# Altium schematic sheet CW341_PowerMeasure.SchDoc: <Enter Sheet Title>
size Letter; Organization: NewAE Technology Inc.; Address1: 1083 Queen St., Suite 196; Address2: Halifax; Address3: NS; Address4: Canada B3H 0B2; SheetNumber: 12; SheetTotal: 16; SheetApproved: NO
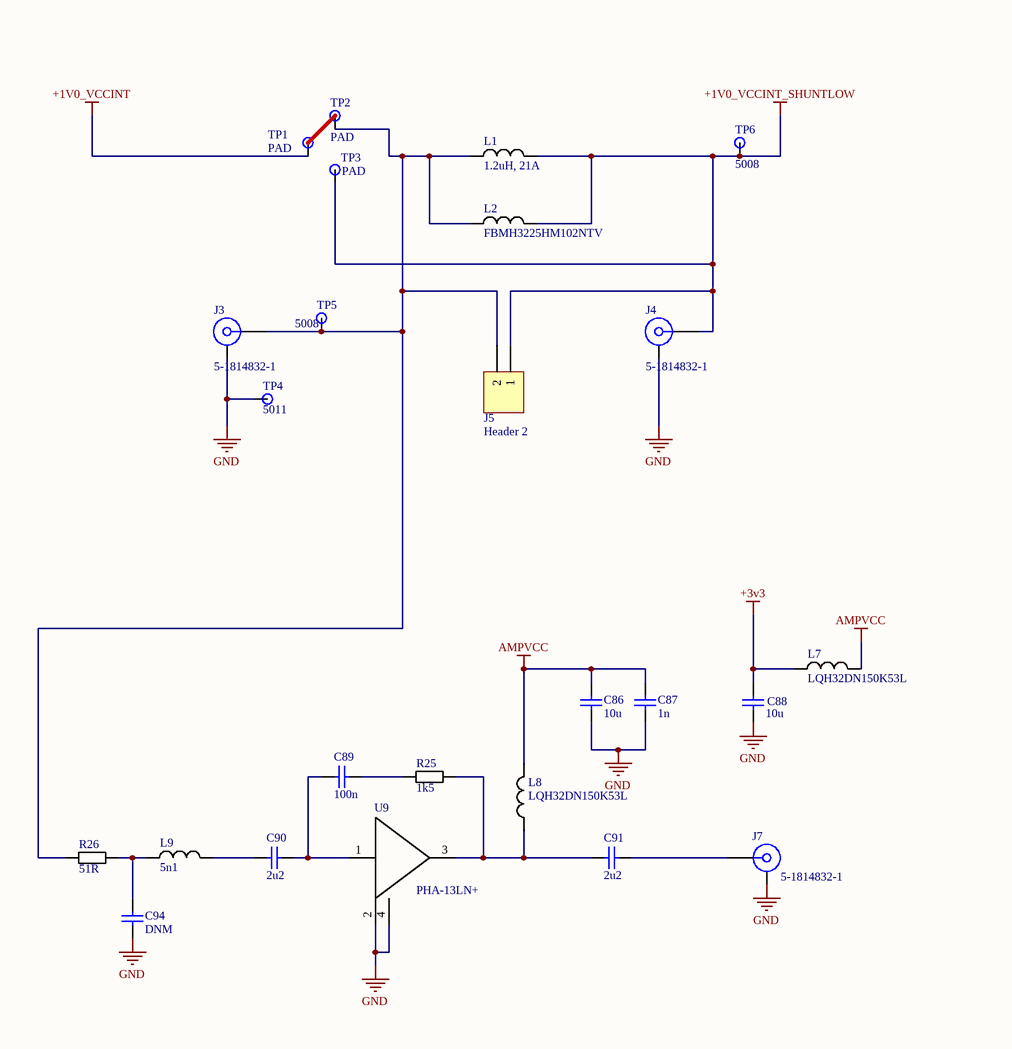
[diagram p0: CW341_PowerMeasure.SchDoc, left]
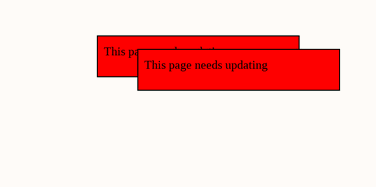
[diagram p1: CW341_PowerMeasure.SchDoc, right]

## Parts
C86  10u  [CAPC0603_M]
C87  1n  [CAPC0603_M]
C88  10u  [CAPC0603_M]
C89  100n  [CAPC0402_M]
C90  2u2  [CAPC0603_M]
C91  2u2  [CAPC0603_M]
C94  DNM  [CAPC0603_M]
J3  5-1814832-1  [SMA_VERT_1.65MMHOLE]
J4  5-1814832-1  [SMA_VERT_1.65MMHOLE]
J5  Header 2  [HDR1X2]
J7  5-1814832-1  [SMA_VERT_1.65MMHOLE]
L1  1.2uH, 21A  [XAL7070-122]
L2  FBMH3225HM102NTV  [INDC3225X06N]
L7  LQH32DN150K53L  [INDC3225X06N]
L8  LQH32DN150K53L  [INDC3225X06N_LQH32]
L9  5n1  [IND_0603]
R25  1k5  [RESC1608X55N]
R26  51R  [RESC1608X55N]
TP1  PAD  [9022-0-00-15-00-00-33-0]
TP2  PAD  [9022-0-00-15-00-00-33-0]
TP3  PAD  [9022-0-00-15-00-00-33-0]
TP4  5011  [KEYSTONE5011]
TP5  5008  [KEYSTONE5008]
TP6  5008  [KEYSTONE5008]
U9  PHA-13LN+  [PHA13LN]

## Nets
+1V0_VCCINT: TP1.1
+1V0_VCCINT_SHUNTLOW: J4.1 J5.1 L1.2 L2.2 TP3.1 TP6.1
+3v3: C88.1 L7.1
AMPVCC: C86.2 C87.2 L7.2 L8.2
GND: C86.1 C87.1 C88.2 C94.2 J3.MH J4.MH J7.MH TP4.1 U9.2(GROUND_1) U9.4(GROUND_2)
NetC89_1: C89.1 C90.2 U9.1(RF-IN)
NetC89_2: C89.2 R25.1
NetC90_1: C90.1 L9.2
NetC91_1: C91.1 L8.1 R25.2 U9.3(RF-OUT_&_DC-IN)
NetC91_2: C91.2 J7.1
NetC94_1: C94.1 L9.1 R26.2
NetJ3_1: J3.1 J5.2 L1.1 L2.1 R26.1 TP2.1 TP5.1

## Notes on the sheet
- This page needs updating
- Title:
- Date:
- Rev:
- Time:
- Project:
- Sheet
- of
- License:
- Copyright © NewAE Technology Inc.
- Approved:
- NewAE.com
- File:

## Library data of the parts
C86 C88 = CCHIP-10u-0603: 10u, 0603; Manufacture Part Number 1: GRM188R61C106MA73D; Component Group: Capacitor; Case-EIA: 0603; Case-Metric: 1608; Part Number: CCHIP-10u-0603; Footprint: 0603; Pin Count: 2; Supplier 1: Digi-Key; Supplier Part Number 1: 490-7201-1-ND; Value: 10u; Mounting Technology: SMT; Component Kind: Standard; Component Type: Standard
C87 = CCHIP-1n-0603: 1n, 0603; Manufacture 1: AVX; Manufacture Part Number 1: 06033D102KAT2A; Component Group: Capacitor; Case-EIA: 0603; Case-Metric: 1608; Rated Voltage: 50VDC; Part Number: CCHIP-1n-0603; Footprint: 0603; Pin Count: 2; Supplier 1: Digi-Key; Value: 1n; Mounting Technology: SMT; Component Kind: Standard; Component Type: Standard
C89 = CCHIP-100n-0402: 100n, 0402; Manufacture Part Number 1: CGA2B3X7R1V104K050BB; Component Group: Capacitor; Case-EIA: 0402; Part Number: CCHIP-100n-0402; Footprint: 0402; Pin Count: 2; Supplier 1: Digi-Key; Supplier Part Number 1: 445-6901-1-ND; Value: 100n; Mounting Technology: SMT; Component Kind: Standard; Component Type: Standard
C90 C91 = CCHIP-2u2-0603: 2u2, 0603; Manufacture 1: Samsung; Manufacture Part Number 1: CL10B225KP8NNNC; Component Group: Capacitor; Case-EIA: 0603; Case-Metric: 1608; Rated Voltage: 10VDC; Part Number: CCHIP-2u2-0603; Footprint: 0603; Pin Count: 2; Supplier 1: Digi-Key; Supplier Part Number 1: 1276-1134-1-ND; Value: 2u2; Mounting Technology: SMT; Component Kind: Standard; Component Type: Standard
C94 = CCHIP-DNM-0603: DNM, 0603; Component Group: Capacitor; Case-EIA: 0603; Part Number: CCHIP-DNM-0603; Footprint: 0603; Pin Count: 2; Value: DNM; Mounting Technology: SMT; Component Kind: Standard; Component Type: Standard
J3 J4 J7 = 5-1814832-1: SMA, Vert; Manufacture 1: TE Connectivity; Component Group: Connector; Part Number: 5-1814832-1; Manufacture Part Number 1: 5-1814832-1; Pin Count: 2; Supplier 1: Digi-Key; Supplier Part Number 1: A97594-ND; Component Kind: Standard; Component Type: Standard
J5 = Header 2: Header, 2-Pin; LatestRevisionDate: 17-Jul-2002; LatestRevisionNote: Re-released for DXP Platform.; Publisher: Altium Limited
L1 = XAL7070-122MEB: 1.2uH, 21A RMS; Manufacture 1: Coilcraft; Component Group: Inductor; PP Material Stack: 0; Part Number: XAL7070-122MEB; Footprint: XAL7070; Manufacture Part Number 1: XAL7070-122MEB; Pin Count: 2; Supplier 1: Mouser; Value: 1.2uH, 21A; Component Kind: Standard; Component Type: Standard; PP Rotation: 0; PP Rotation1: 0
L2 = FBCHIP-1K-1210: Ferrite Bead, 1K@100MHz, 2A, 1210, 100mOhm DC, AEC-Q200; Manufacture 1: Taiyo Yuden; Component Group: Inductor; Case-EIA: 1210; Case-Metric: 3225; PP Material Stack: 0; Part Number: FBCHIP-1K-1210; Footprint: 1210; Manufacture Part Number 1: FBMH3225HM102NTV; Pin Count: 2; Supplier 1: Digi-Key; Supplier Part Number 1: 587-3835-1-ND; Value: 1k@100MHz; Mounting Technology: SMT; RoHS: Yes; Temperature Range: -40C to 125C; Component Kind: Standard; Component Type: Standard; PP Rotation: 0
L7 = FBCHIP-1K-1210: Ferrite Bead, 1K@100MHz, 2A, 1210, 100mOhm DC, AEC-Q200; Manufacture 1: Taiyo Yuden; Manufacture Part Number 1: FBMH3225HM102NTV; Component Group: Inductor; Case-EIA: 1210; Case-Metric: 3225; PP Material Stack: 0; Part Number: FBCHIP-1K-1210; Footprint: 1210; Pin Count: 2; Supplier 1: Digi-Key; Supplier Part Number 1: 587-3835-1-ND; Value: 1k@100MHz; Mounting Technology: SMT; RoHS: Yes; Temperature Range: -40C to 125C; Component Kind: Standard; Component Type: Standard; PP Rotation: 0
L8 = LQH32DN150K53L: 15uH, 300mA, 1210 Inductor; Manufacture 1: Murata Electronics; Case-EIA: 1210; Case-Metric: 3225; PP Material Stack: 0; Part Number: LQH32DN150K53L; Component Group: Inductor; Footprint: 1210; Manufacture Part Number 1: LQH32DN150K53L; Pin Count: 2; Supplier 1: Digi-Key; Supplier Part Number 1: 490-9909-1-ND; Mounting Technology: SMT; RoHS: Yes; Temperature Range: -40C to 125C; Component Kind: Standard; Component Type: Standard; PP Rotation: 0
L9 = LCHIP-5N1-0603: FIXED IND 5.1nH; Manufacture 1: Coilcraft; Manufacture Part Number 1: 0603CS-5N1XJLU; Component Group: Inductor; Case-EIA: 0603; Case-Metric: 1608; Tolerance: ±5%; PP Material Stack: 0; Part Number: LCHIP-5N1-0603; Footprint: 0603; Pin Count: 2; Supplier 1: Mouser; Supplier Part Number 1: 994-0603CS-5N1XJLU; Value: 5n1; Mounting Technology: SMT; Component Kind: Standard; Component Type: Standard; PP Rotation: 0
R25 = RCHIP-1K5-0603: 1k5 res, 0603, 1%, 1/10W; Manufacture 1: Yageo; Manufacture Part Number 1: RC0603FR-071K5L; Component Group: Resistor; Case-EIA: 0603; Case-Metric: 1608; Rated Power: 0.1W; Rated Voltage: 75VDC; Part Number: RCHIP-1K5-0603; Footprint: 0603; Pin Count: 2; Supplier 1: Digi-Key; Supplier Part Number 1: 311-1.50KHRCT-ND; Value: 1k5; Tolerance: 1%; Mounting Technology: SMT; Temperature Range: -55C to 155C; Component Kind: Standard; Component Type: Standard
R26 = RCHIP-51R-0603: 51R res, 0603, 1%, 1/10W; Manufacture 1: Yageo; Manufacture Part Number 1: RC0603FR-0751RL; Component Group: Resistor; Case-EIA: 0603; Case-Metric: 1608; Rated Power: 0.1W; Rated Voltage: 75VDC; Part Number: RCHIP-51R-0603; Footprint: 0603; Pin Count: 2; Supplier 1: Digi-Key; Supplier Part Number 1: 311-51.0HRCT-ND; Value: 51R; Tolerance: 1%; Mounting Technology: SMT; Temperature Range: -55C to 155C; Component Kind: Standard; Component Type: Standard
TP1-TP3 = TESTPAD_9022-0-00-15-00-00-33-0: Manufacture 1: Mill-Max Manufacturing Corp.; Component Group: Test Point; Part Number: TESTPAD_9022-0-00-15-00-00-33-0; Manufacture Part Number 1: 9022-0-00-15-00-00-33-0; Pin Count: 1; Supplier 1: Digi-Key; Supplier Part Number 1: ED90411-ND; Mounting Technology: Through-hole; Component Kind: Standard; Component Type: Standard
TP4 = KEYSTONE_5011: TEST POINT PC MULTI PURPOSE BLK; Part Number: KEYSTONE_5011; Component Group: Test Point; Pin Count: 1; Supplier 1: Digi-Key; Supplier Part Number 1: 36-5011-ND; Mounting Technology: Through-hole; Component Kind: Standard; Component Type: Standard
TP5 TP6 = KEYSTONE_5008: TEST POINT PC COMPACT .063"D ORG; Part Number: KEYSTONE_5008; Component Group: Test Point; Pin Count: 1; Supplier 1: Digi-Key; Supplier Part Number 1: 36-5008-ND; Mounting Technology: Through-hole; Component Kind: Standard; Component Type: Standard
U9 = PHA-13LN+: Integrated Circuit; Manufacturer_Name: Mini-Circuits; Datasheet Link: https://www.minicircuits.com/pdfs/PHA-13LN+.pdf; Height: 1.6mm; Manufacturer_Part_Number: PHA-13LN+; Mouser Part Number: 139-PHA-13LN; Mouser Price/Stock: https://www.mouser.co.uk/ProductDetail/Mini-Circuits/PHA-13LN%2b?qs=xZ%2FP%252Ba9zWqYkwnUBoTp7PQ%3D%3D